# Altium schematic sheet 08_J2_CONN.SchDoc
size 420 x 297 mm; SheetNumber: 8; SheetTotal: 8
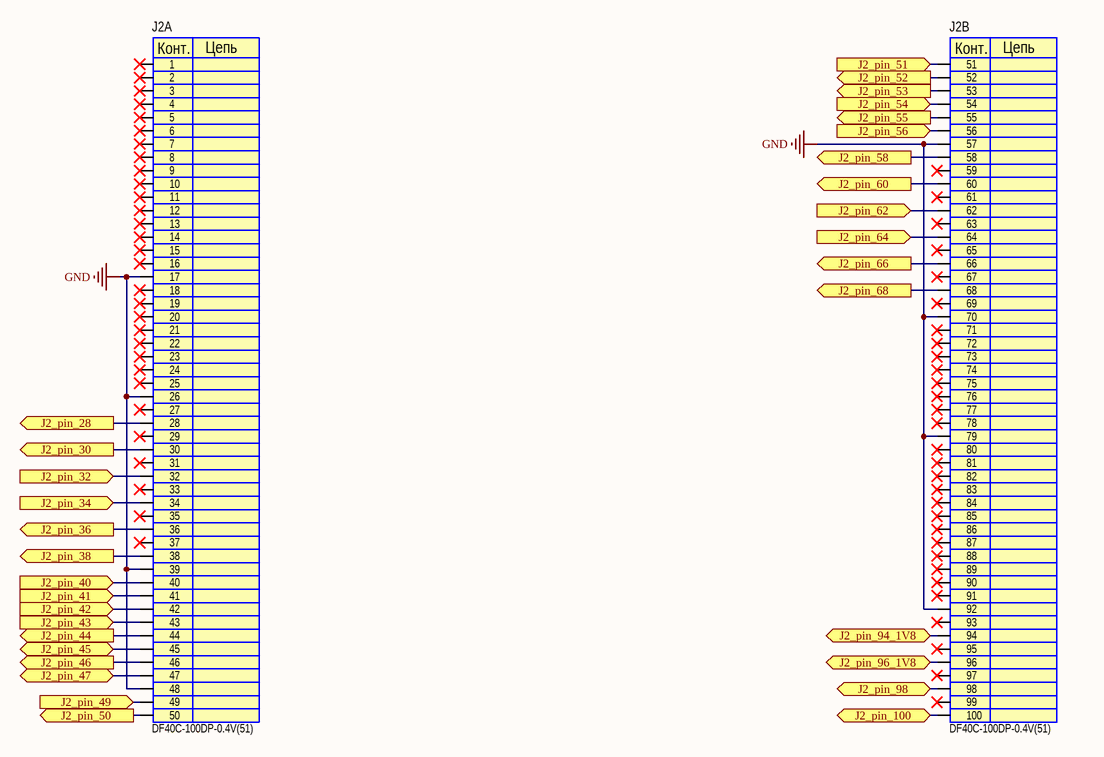
[diagram p0: 08_J2_CONN.SchDoc]

## Parts
J2  DF40C-100DP-0.4V(51)  [CONN100_DF40C-100DP-0.4V51_HIR]  (parts A,B of 2)

## Ports
J2_pin_28 (out), J2_pin_30 (out), J2_pin_32 (in), J2_pin_34 (in), J2_pin_36 (out), J2_pin_38 (out), J2_pin_40 (in), J2_pin_41 (in), J2_pin_42 (in), J2_pin_43 (in), J2_pin_44 (out), J2_pin_45 (bidir), J2_pin_46 (out), J2_pin_47 (bidir), J2_pin_49 (in), J2_pin_50 (out), J2_pin_51 (in), J2_pin_52 (out), J2_pin_53 (out), J2_pin_54 (in), J2_pin_55 (out), J2_pin_56 (in), J2_pin_58 (out), J2_pin_60 (out), J2_pin_62 (in), J2_pin_64 (in), J2_pin_66 (out), J2_pin_68 (out), J2_pin_94_1V8 (bidir), J2_pin_96_1V8 (bidir), J2_pin_98 (bidir), J2_pin_100 (bidir)

## Nets
GND: J2.17 J2.26 J2.39 J2.48 J2.57 J2.70 J2.79 J2.92
J2_pin_28: J2.28 ; port J2_pin_28
J2_pin_30: J2.30 ; port J2_pin_30
J2_pin_32: J2.32 ; port J2_pin_32
J2_pin_34: J2.34 ; port J2_pin_34
J2_pin_36: J2.36 ; port J2_pin_36
J2_pin_38: J2.38 ; port J2_pin_38
J2_pin_40: J2.40 ; port J2_pin_40
J2_pin_41: J2.41 ; port J2_pin_41
J2_pin_42: J2.42 ; port J2_pin_42
J2_pin_43: J2.43 ; port J2_pin_43
J2_pin_44: J2.44 ; port J2_pin_44
J2_pin_45: J2.45 ; port J2_pin_45
J2_pin_46: J2.46 ; port J2_pin_46
J2_pin_47: J2.47 ; port J2_pin_47
J2_pin_49: J2.49 ; port J2_pin_49
J2_pin_50: J2.50 ; port J2_pin_50
J2_pin_51: J2.51 ; port J2_pin_51
J2_pin_52: J2.52 ; port J2_pin_52
J2_pin_53: J2.53 ; port J2_pin_53
J2_pin_54: J2.54 ; port J2_pin_54
J2_pin_55: J2.55 ; port J2_pin_55
J2_pin_56: J2.56 ; port J2_pin_56
J2_pin_58: J2.58 ; port J2_pin_58
J2_pin_60: J2.60 ; port J2_pin_60
J2_pin_62: J2.62 ; port J2_pin_62
J2_pin_64: J2.64 ; port J2_pin_64
J2_pin_66: J2.66 ; port J2_pin_66
J2_pin_68: J2.68 ; port J2_pin_68
J2_pin_94_1V8: J2.94 ; port J2_pin_94_1V8
J2_pin_96_1V8: J2.96 ; port J2_pin_96_1V8
J2_pin_98: J2.98 ; port J2_pin_98
J2_pin_100: J2.100 ; port J2_pin_100

Not connected (* = marked no-connect by the designer): J2 1* 2* 3* 4* 5* 6* 7* 8* 9* 10* 11* 12* 13* 14* 15* 16* 18* 19* 20* 21* 22* 23* 24* 25* 27* 29* 31* 33* 35* 37* 59* 61* 63* 65* 67* 69* 71* 72* 73* 74* 75* 76* 77* 78* 80* 81* 82* 83* 84* 85* 86* 87* 88* 89* 90* 91* 93* 95* 97* 99*

## Notes on the sheet
- THIS DOCUMENT AND THE DATA DISCLOSED HEREIN OR
- HEREWITH IS THE PROPERTY OF ALTIUM LIMITED AND MAY
- DWG NO:
- REVISION
- REV:
- DESCRIPTION
- DATE
- APPROVED
- BE FREELY DISTRIBUTED IN WHOLE. NO RIGHTS ARE
- RESERVED OR EXPRESS OR IMPLIED WARANTEE GIVEN.
- ENG:
- APPROVALS
- PROJECT
- DSN:
- CHK:
- REFERENCE DOCUMENTS
- PROJECT REVISION:
- TITLE
- DOCUMENT REVISION:
- DESIGN ITEM:
- BOM:
- FAB DWG:
- PCB DWG:
- ASSY DWG:
- SCALE:
- A3
- SIZE
- CAGE CODE
- FILE NAME
- DWG NO.
- SHEET
- OF
- REV
- (in symbol DF40C-100DP-0.4V(51), part A) Конт.; Цепь
- (in symbol DF40C-100DP-0.4V(51), part B) Конт.; Цепь

## Library data of the parts
J2 = DF40C-100DP-0.4V(51): 0.5mm Pitch SMT Board-to-Board Connector; Manufacturer: Hirose; Row: 2; Positions: 100; Male/Female: F; ComponentLink1Description: Link; ComponentLink1URL: https://www.hirose.com/ru/product/document?clcode=CL0684-4032-1-51&productname=DF40C-100DP-0.4V(51)&series=DF40&documenttype=2DDrawing&lang=ru&documentid=0001001212; ComponentLink2Description: LocalLink; ComponentLink2URL: C:\Users\Public\Documents\Altium\Datasheet\Connectors\DF40C-100DP-0.4V(51)_CL0684-4032-1-51_2DDrawing_0001001212.pdf; Type: Board-to-Board; Temperature: -40...+105°C; PartNumber: DF40C-100DP-0.4V(51)